# Altium schematic sheet Top_Board.SchDoc
size A3; SheetNumber: 1; SheetTotal: 9
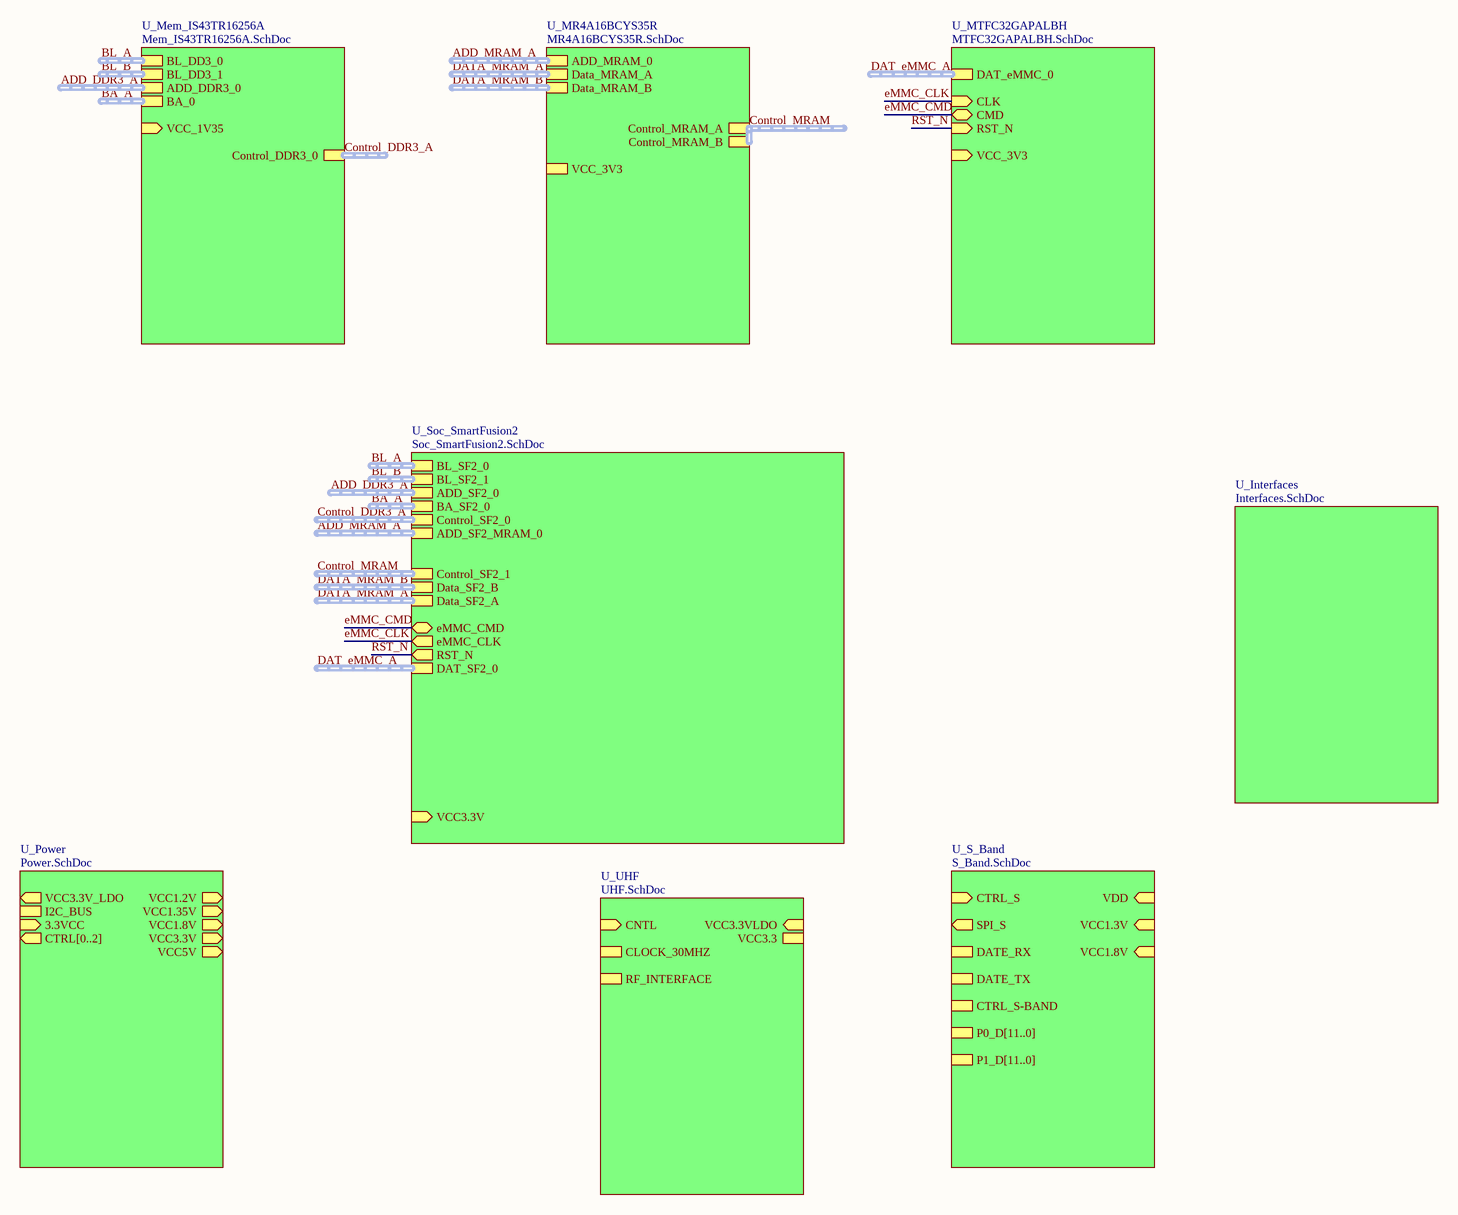
[diagram p0: Top_Board.SchDoc]

## Sub-sheets
U_Interfaces = Interfaces.SchDoc: no entries
U_Mem_IS43TR16256A = Mem_IS43TR16256A.SchDoc: ADD_DDR3_0 (harness ADD_DDR3), BA_0 (harness BA), VCC_1V35 (in), BL_DD3_0 (harness Byte_Lane), BL_DD3_1 (harness Byte_Lane), Control_DDR3_0 (harness Control_DDR3)
U_MR4A16BCYS35R = MR4A16BCYS35R.SchDoc: ADD_MRAM_0 (harness ADD_MRAM), Data_MRAM_A (harness Data_MRAM), Data_MRAM_B (harness Data_MRAM), Control_MRAM_B (harness Control_MRAM), Control_MRAM_A (harness Control_MRAM), VCC_3V3
U_MTFC32GAPALBH = MTFC32GAPALBH.SchDoc: CLK (in), RST_N (in), VCC_3V3 (in), DAT_eMMC_0 (harness DAT_eMMC), CMD (bidir)
U_Power = Power.SchDoc: VCC1.2V (out), VCC1.35V (out), VCC1.8V (out), VCC3.3V (out), VCC5V (out), VCC3.3V_LDO (out), I2C_BUS (harness I2C_BUS), 3.3VCC (in), CTRL[0..2] (out)
U_S_Band = S_Band.SchDoc: VDD (in), CTRL_S (in), SPI_S (out, harness SPI), DATE_RX (harness DATE_RX), DATE_TX (harness DATE_TX), VCC1.3V (in), VCC1.8V (in), CTRL_S-BAND (harness CTRL_S-BAND), P0_D[11..0] (harness P0_D[11..0]), P1_D[11..0] (harness P1_D[11..0])
U_Soc_SmartFusion2 = Soc_SmartFusion2.SchDoc: BL_SF2_0 (harness Byte_Lane), BL_SF2_1 (harness Byte_Lane), ADD_SF2_0 (harness ADD_DDR3), BA_SF2_0 (harness BA), Control_SF2_0 (harness Control_DDR3), ADD_SF2_MRAM_0 (harness ADD_MRAM), VCC3.3V (in), Control_SF2_1 (harness Control_MRAM), Data_SF2_B (harness Data_MRAM), Data_SF2_A (harness Data_MRAM), eMMC_CMD (bidir), eMMC_CLK (out), RST_N (out), DAT_SF2_0 (harness DAT_eMMC)
U_UHF = UHF.SchDoc: VCC3.3VLDO (in), CNTL (in), VCC3.3, CLOCK_30MHZ (harness CLOCK_30MHZ), RF_INTERFACE (harness RF_INTERFACE)

## Nets
eMMC_CLK: sheet U_Soc_SmartFusion2/eMMC_CLK, sheet U_MTFC32GAPALBH/CLK
eMMC_CMD: sheet U_Soc_SmartFusion2/eMMC_CMD, sheet U_MTFC32GAPALBH/CMD
RST_N: sheet U_Soc_SmartFusion2/RST_N, sheet U_MTFC32GAPALBH/RST_N

## Buses and harness runs
harness ADD_DDR3_A = sheet U_Mem_IS43TR16256A/ADD_DDR3_0
harness ADD_DDR3_A = sheet U_Soc_SmartFusion2/ADD_SF2_0
harness ADD_MRAM_A = sheet U_MR4A16BCYS35R/ADD_MRAM_0
harness ADD_MRAM_A = sheet U_Soc_SmartFusion2/ADD_SF2_MRAM_0
harness BA_A = sheet U_Mem_IS43TR16256A/BA_0
harness BA_A = sheet U_Soc_SmartFusion2/BA_SF2_0
harness BL_A = sheet U_Mem_IS43TR16256A/BL_DD3_0
harness BL_A = sheet U_Soc_SmartFusion2/BL_SF2_0
harness BL_B = sheet U_Mem_IS43TR16256A/BL_DD3_1
harness BL_B = sheet U_Soc_SmartFusion2/BL_SF2_1
harness Control_DDR3_A = sheet U_Mem_IS43TR16256A/Control_DDR3_0
harness Control_DDR3_A = sheet U_Soc_SmartFusion2/Control_SF2_0
harness Control_MRAM = sheet U_MR4A16BCYS35R/Control_MRAM_A = sheet U_MR4A16BCYS35R/Control_MRAM_B
harness Control_MRAM = sheet U_Soc_SmartFusion2/Control_SF2_1
harness DAT_eMMC_A = sheet U_MTFC32GAPALBH/DAT_eMMC_0
harness DAT_eMMC_A = sheet U_Soc_SmartFusion2/DAT_SF2_0
harness DATA_MRAM_A = sheet U_MR4A16BCYS35R/Data_MRAM_A
harness DATA_MRAM_A = sheet U_Soc_SmartFusion2/Data_SF2_A
harness DATA_MRAM_B = sheet U_MR4A16BCYS35R/Data_MRAM_B
harness DATA_MRAM_B = sheet U_Soc_SmartFusion2/Data_SF2_B